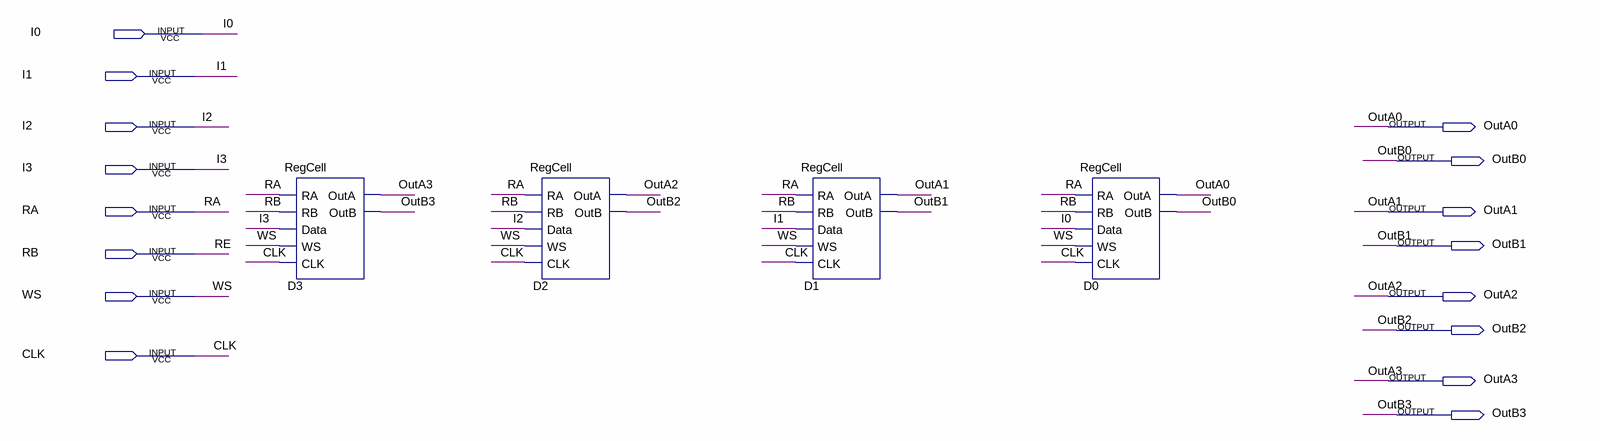
[diagram p0: schematic sheet]
// Quartus schematic Reg4b.bdf as structural Verilog: 4 symbols, 16 pins
module Reg4b (
  input  I0,
  input  I1,
  input  I2,
  input  I3,
  input  RA,
  input  RB,
  input  WS,
  input  CLK,
  output OutA0,
  output OutB0,
  output OutA1,
  output OutB1,
  output OutA2,
  output OutB2,
  output OutA3,
  output OutB3
);

  RegCell D3 (.RA(RA), .RB(RB), .Data(I3), .WS(WS), .CLK(CLK), .OutA(OutA3), .OutB(OutB3));
  RegCell D2 (.RA(RA), .RB(RB), .Data(I2), .WS(WS), .CLK(CLK), .OutA(OutA2), .OutB(OutB2));
  RegCell D1 (.RA(RA), .RB(RB), .Data(I1), .WS(WS), .CLK(CLK), .OutA(OutA1), .OutB(OutB1));
  RegCell D0 (.RA(RA), .RB(RB), .Data(I0), .WS(WS), .CLK(CLK), .OutA(OutA0), .OutB(OutB0));

  // Other names for the same wires on the sheet: RE = RB
endmodule
